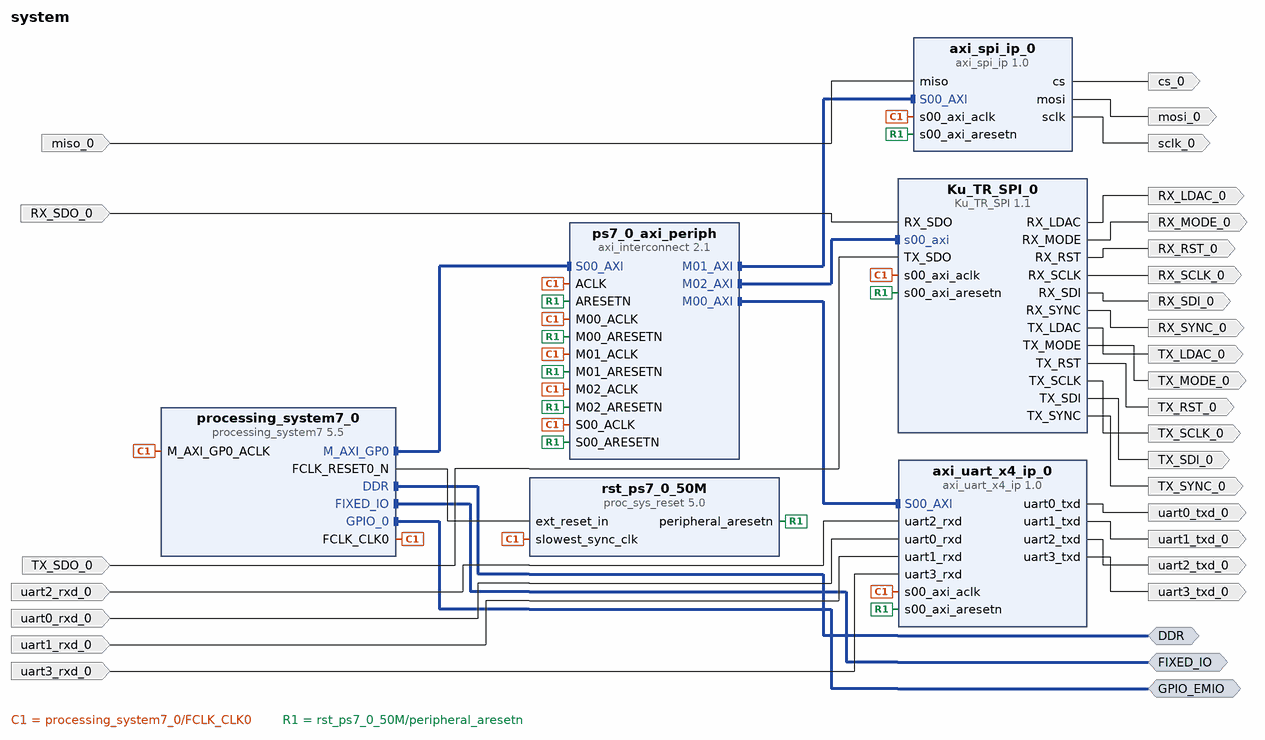
[diagram p0: block diagram of the top level]
# Vivado block design system, xc7z020clg484-2, Vivado 2018.3
create_bd_design system

create_bd_intf_port -mode Master -vlnv xilinx.com:interface:ddrx_rtl:1.0 DDR
create_bd_intf_port -mode Master -vlnv xilinx.com:display_processing_system7:fixedio_rtl:1.0 FIXED_IO
create_bd_intf_port -mode Master -vlnv xilinx.com:interface:gpio_rtl:1.0 GPIO_EMIO
create_bd_port -dir O uart1_txd_0
create_bd_port -dir O uart2_txd_0
create_bd_port -dir O uart0_txd_0
create_bd_port -dir O uart3_txd_0
create_bd_port -dir I uart2_rxd_0
create_bd_port -dir I uart0_rxd_0
create_bd_port -dir I uart1_rxd_0
create_bd_port -dir I uart3_rxd_0
create_bd_port -dir O mosi_0
create_bd_port -dir O sclk_0
create_bd_port -dir I miso_0
create_bd_port -dir O cs_0
create_bd_port -dir O RX_LDAC_0
create_bd_port -dir O RX_MODE_0
create_bd_port -dir O -type rst RX_RST_0
create_bd_port -dir O RX_SCLK_0
create_bd_port -dir O RX_SDI_0
create_bd_port -dir I RX_SDO_0
create_bd_port -dir O RX_SYNC_0
create_bd_port -dir O TX_LDAC_0
create_bd_port -dir O TX_MODE_0
create_bd_port -dir O -type rst TX_RST_0
create_bd_port -dir O TX_SCLK_0
create_bd_port -dir O TX_SDI_0
create_bd_port -dir I TX_SDO_0
create_bd_port -dir O TX_SYNC_0

create_bd_cell -type ip -vlnv xilinx.com:ip:processing_system7:5.5 processing_system7_0
set_property -dict [list \
  CONFIG.PCW_ENET0_ENET0_IO {MIO 16 .. 27} \
  CONFIG.PCW_ENET0_GRP_MDIO_ENABLE 1 \
  CONFIG.PCW_ENET0_GRP_MDIO_IO {MIO 52 .. 53} \
  CONFIG.PCW_ENET0_PERIPHERAL_ENABLE 1 \
  CONFIG.PCW_GPIO_EMIO_GPIO_ENABLE 1 \
  CONFIG.PCW_GPIO_EMIO_GPIO_IO 18 \
  CONFIG.PCW_GPIO_EMIO_GPIO_WIDTH 18 \
  CONFIG.PCW_IRQ_F2P_INTR 1 \
  CONFIG.PCW_PRESET_BANK1_VOLTAGE {LVCMOS 1.8V} \
  CONFIG.PCW_QSPI_GRP_SINGLE_SS_ENABLE 1 \
  CONFIG.PCW_QSPI_GRP_SINGLE_SS_IO {MIO 1 .. 6} \
  CONFIG.PCW_QSPI_PERIPHERAL_ENABLE 1 \
  CONFIG.PCW_QSPI_QSPI_IO {MIO 1 .. 6} \
  CONFIG.PCW_SINGLE_QSPI_DATA_MODE x4 \
  CONFIG.PCW_UART0_PERIPHERAL_ENABLE 1 \
  CONFIG.PCW_UART0_UART0_IO {MIO 14 .. 15} \
  CONFIG.PCW_UART_PERIPHERAL_FREQMHZ 100 \
  CONFIG.PCW_UIPARAM_DDR_BUS_WIDTH {16 Bit} \
  CONFIG.PCW_UIPARAM_DDR_PARTNO {MT41K256M16 RE-125} \
  CONFIG.PCW_USE_FABRIC_INTERRUPT 1 \
] [get_bd_cells processing_system7_0]
# 108 more settings of processing_system7_0 are not shown: defaults, MIO pin electricals, DDR timing, and values the tool derives
create_bd_cell -type ip -vlnv xilinx.com:ip:axi_interconnect:2.1 ps7_0_axi_periph
set_property -dict {CONFIG.NUM_MI 3} [get_bd_cells ps7_0_axi_periph]
create_bd_cell -type ip -vlnv xilinx.com:ip:proc_sys_reset:5.0 rst_ps7_0_50M
create_bd_cell -type ip -vlnv GeeSpace.com:user:axi_uart_x4_ip:1.0 axi_uart_x4_ip_0
set_property -dict {CONFIG.UART1_BPS 9600 CONFIG.UART3_BPS 921600} [get_bd_cells axi_uart_x4_ip_0]
create_bd_cell -type ip -vlnv GeeSpace.com:user:axi_spi_ip:1.0 axi_spi_ip_0
set_property -dict {CONFIG.CLK_DIV 16} [get_bd_cells axi_spi_ip_0]
create_bd_cell -type ip -vlnv xilinx.com:user:Ku_TR_SPI:1.1 Ku_TR_SPI_0

# ---- connections ----

connect_bd_intf_net [get_bd_intf_ports DDR] [get_bd_intf_pins processing_system7_0/DDR]
connect_bd_intf_net [get_bd_intf_pins ps7_0_axi_periph/M01_AXI] [get_bd_intf_pins axi_spi_ip_0/S00_AXI]
connect_bd_intf_net [get_bd_intf_ports FIXED_IO] [get_bd_intf_pins processing_system7_0/FIXED_IO]
connect_bd_intf_net [get_bd_intf_pins processing_system7_0/M_AXI_GP0] [get_bd_intf_pins ps7_0_axi_periph/S00_AXI]
connect_bd_intf_net [get_bd_intf_ports GPIO_EMIO] [get_bd_intf_pins processing_system7_0/GPIO_0]
connect_bd_intf_net [get_bd_intf_pins ps7_0_axi_periph/M00_AXI] [get_bd_intf_pins axi_uart_x4_ip_0/S00_AXI]
connect_bd_intf_net [get_bd_intf_pins ps7_0_axi_periph/M02_AXI] [get_bd_intf_pins Ku_TR_SPI_0/s00_axi]
connect_bd_net [get_bd_pins processing_system7_0/FCLK_CLK0] \
  [get_bd_pins processing_system7_0/M_AXI_GP0_ACLK] [get_bd_pins ps7_0_axi_periph/S00_ACLK] \
  [get_bd_pins rst_ps7_0_50M/slowest_sync_clk] [get_bd_pins ps7_0_axi_periph/M00_ACLK] [get_bd_pins ps7_0_axi_periph/ACLK] \
  [get_bd_pins axi_uart_x4_ip_0/s00_axi_aclk] [get_bd_pins axi_spi_ip_0/s00_axi_aclk] [get_bd_pins ps7_0_axi_periph/M01_ACLK] \
  [get_bd_pins ps7_0_axi_periph/M02_ACLK] [get_bd_pins Ku_TR_SPI_0/s00_axi_aclk]
connect_bd_net [get_bd_pins processing_system7_0/FCLK_RESET0_N] [get_bd_pins rst_ps7_0_50M/ext_reset_in]
connect_bd_net [get_bd_pins rst_ps7_0_50M/peripheral_aresetn] \
  [get_bd_pins ps7_0_axi_periph/S00_ARESETN] [get_bd_pins ps7_0_axi_periph/M00_ARESETN] \
  [get_bd_pins ps7_0_axi_periph/ARESETN] [get_bd_pins axi_uart_x4_ip_0/s00_axi_aresetn] \
  [get_bd_pins axi_spi_ip_0/s00_axi_aresetn] [get_bd_pins ps7_0_axi_periph/M01_ARESETN] \
  [get_bd_pins ps7_0_axi_periph/M02_ARESETN] [get_bd_pins Ku_TR_SPI_0/s00_axi_aresetn]
connect_bd_net [get_bd_pins axi_uart_x4_ip_0/uart1_txd] [get_bd_ports uart1_txd_0]
connect_bd_net [get_bd_pins axi_uart_x4_ip_0/uart2_txd] [get_bd_ports uart2_txd_0]
connect_bd_net [get_bd_pins axi_uart_x4_ip_0/uart0_txd] [get_bd_ports uart0_txd_0]
connect_bd_net [get_bd_pins axi_uart_x4_ip_0/uart3_txd] [get_bd_ports uart3_txd_0]
connect_bd_net -net uart2_rxd_0_1 [get_bd_ports uart2_rxd_0] [get_bd_pins axi_uart_x4_ip_0/uart2_rxd]
connect_bd_net -net uart0_rxd_0_1 [get_bd_ports uart0_rxd_0] [get_bd_pins axi_uart_x4_ip_0/uart0_rxd]
connect_bd_net -net uart1_rxd_0_1 [get_bd_ports uart1_rxd_0] [get_bd_pins axi_uart_x4_ip_0/uart1_rxd]
connect_bd_net -net uart3_rxd_0_1 [get_bd_ports uart3_rxd_0] [get_bd_pins axi_uart_x4_ip_0/uart3_rxd]
connect_bd_net [get_bd_pins axi_spi_ip_0/mosi] [get_bd_ports mosi_0]
connect_bd_net [get_bd_pins axi_spi_ip_0/sclk] [get_bd_ports sclk_0]
connect_bd_net -net miso_0_1 [get_bd_ports miso_0] [get_bd_pins axi_spi_ip_0/miso]
connect_bd_net [get_bd_pins axi_spi_ip_0/cs] [get_bd_ports cs_0]
connect_bd_net [get_bd_pins Ku_TR_SPI_0/RX_LDAC] [get_bd_ports RX_LDAC_0]
connect_bd_net [get_bd_pins Ku_TR_SPI_0/RX_MODE] [get_bd_ports RX_MODE_0]
connect_bd_net [get_bd_pins Ku_TR_SPI_0/RX_RST] [get_bd_ports RX_RST_0]
connect_bd_net [get_bd_pins Ku_TR_SPI_0/RX_SCLK] [get_bd_ports RX_SCLK_0]
connect_bd_net [get_bd_pins Ku_TR_SPI_0/RX_SDI] [get_bd_ports RX_SDI_0]
connect_bd_net -net RX_SDO_0_1 [get_bd_ports RX_SDO_0] [get_bd_pins Ku_TR_SPI_0/RX_SDO]
connect_bd_net [get_bd_pins Ku_TR_SPI_0/RX_SYNC] [get_bd_ports RX_SYNC_0]
connect_bd_net [get_bd_pins Ku_TR_SPI_0/TX_LDAC] [get_bd_ports TX_LDAC_0]
connect_bd_net [get_bd_pins Ku_TR_SPI_0/TX_MODE] [get_bd_ports TX_MODE_0]
connect_bd_net [get_bd_pins Ku_TR_SPI_0/TX_RST] [get_bd_ports TX_RST_0]
connect_bd_net [get_bd_pins Ku_TR_SPI_0/TX_SCLK] [get_bd_ports TX_SCLK_0]
connect_bd_net [get_bd_pins Ku_TR_SPI_0/TX_SDI] [get_bd_ports TX_SDI_0]
connect_bd_net -net TX_SDO_0_1 [get_bd_ports TX_SDO_0] [get_bd_pins Ku_TR_SPI_0/TX_SDO]
connect_bd_net [get_bd_pins Ku_TR_SPI_0/TX_SYNC] [get_bd_ports TX_SYNC_0]

# ---- address map ----
assign_bd_address -offset 0x43C00000 -range 64K -target_address_space [get_bd_addr_spaces processing_system7_0/Data] [get_bd_addr_segs axi_uart_x4_ip_0/S00_AXI/S00_AXI_reg]
assign_bd_address -offset 0x43C10000 -range 64K -target_address_space [get_bd_addr_spaces processing_system7_0/Data] [get_bd_addr_segs axi_spi_ip_0/S00_AXI/S00_AXI_reg]
assign_bd_address -offset 0x43C20000 -range 64K -target_address_space [get_bd_addr_spaces processing_system7_0/Data] [get_bd_addr_segs Ku_TR_SPI_0/s00_axi/reg0]

validate_bd_design
save_bd_design
